# EasyEDA Pro project 立创·天猛星MSPM0G3507开发板.eprj, schematic Schematic

## Sheets
1 core: Board Name: V1.0.2; Create Date: 2025-05-01; Page Name: core; Project Name: 立创·天猛星MSPM0G3507开发板; Schematic Name: Schematic; Update Date: 2025-05-01
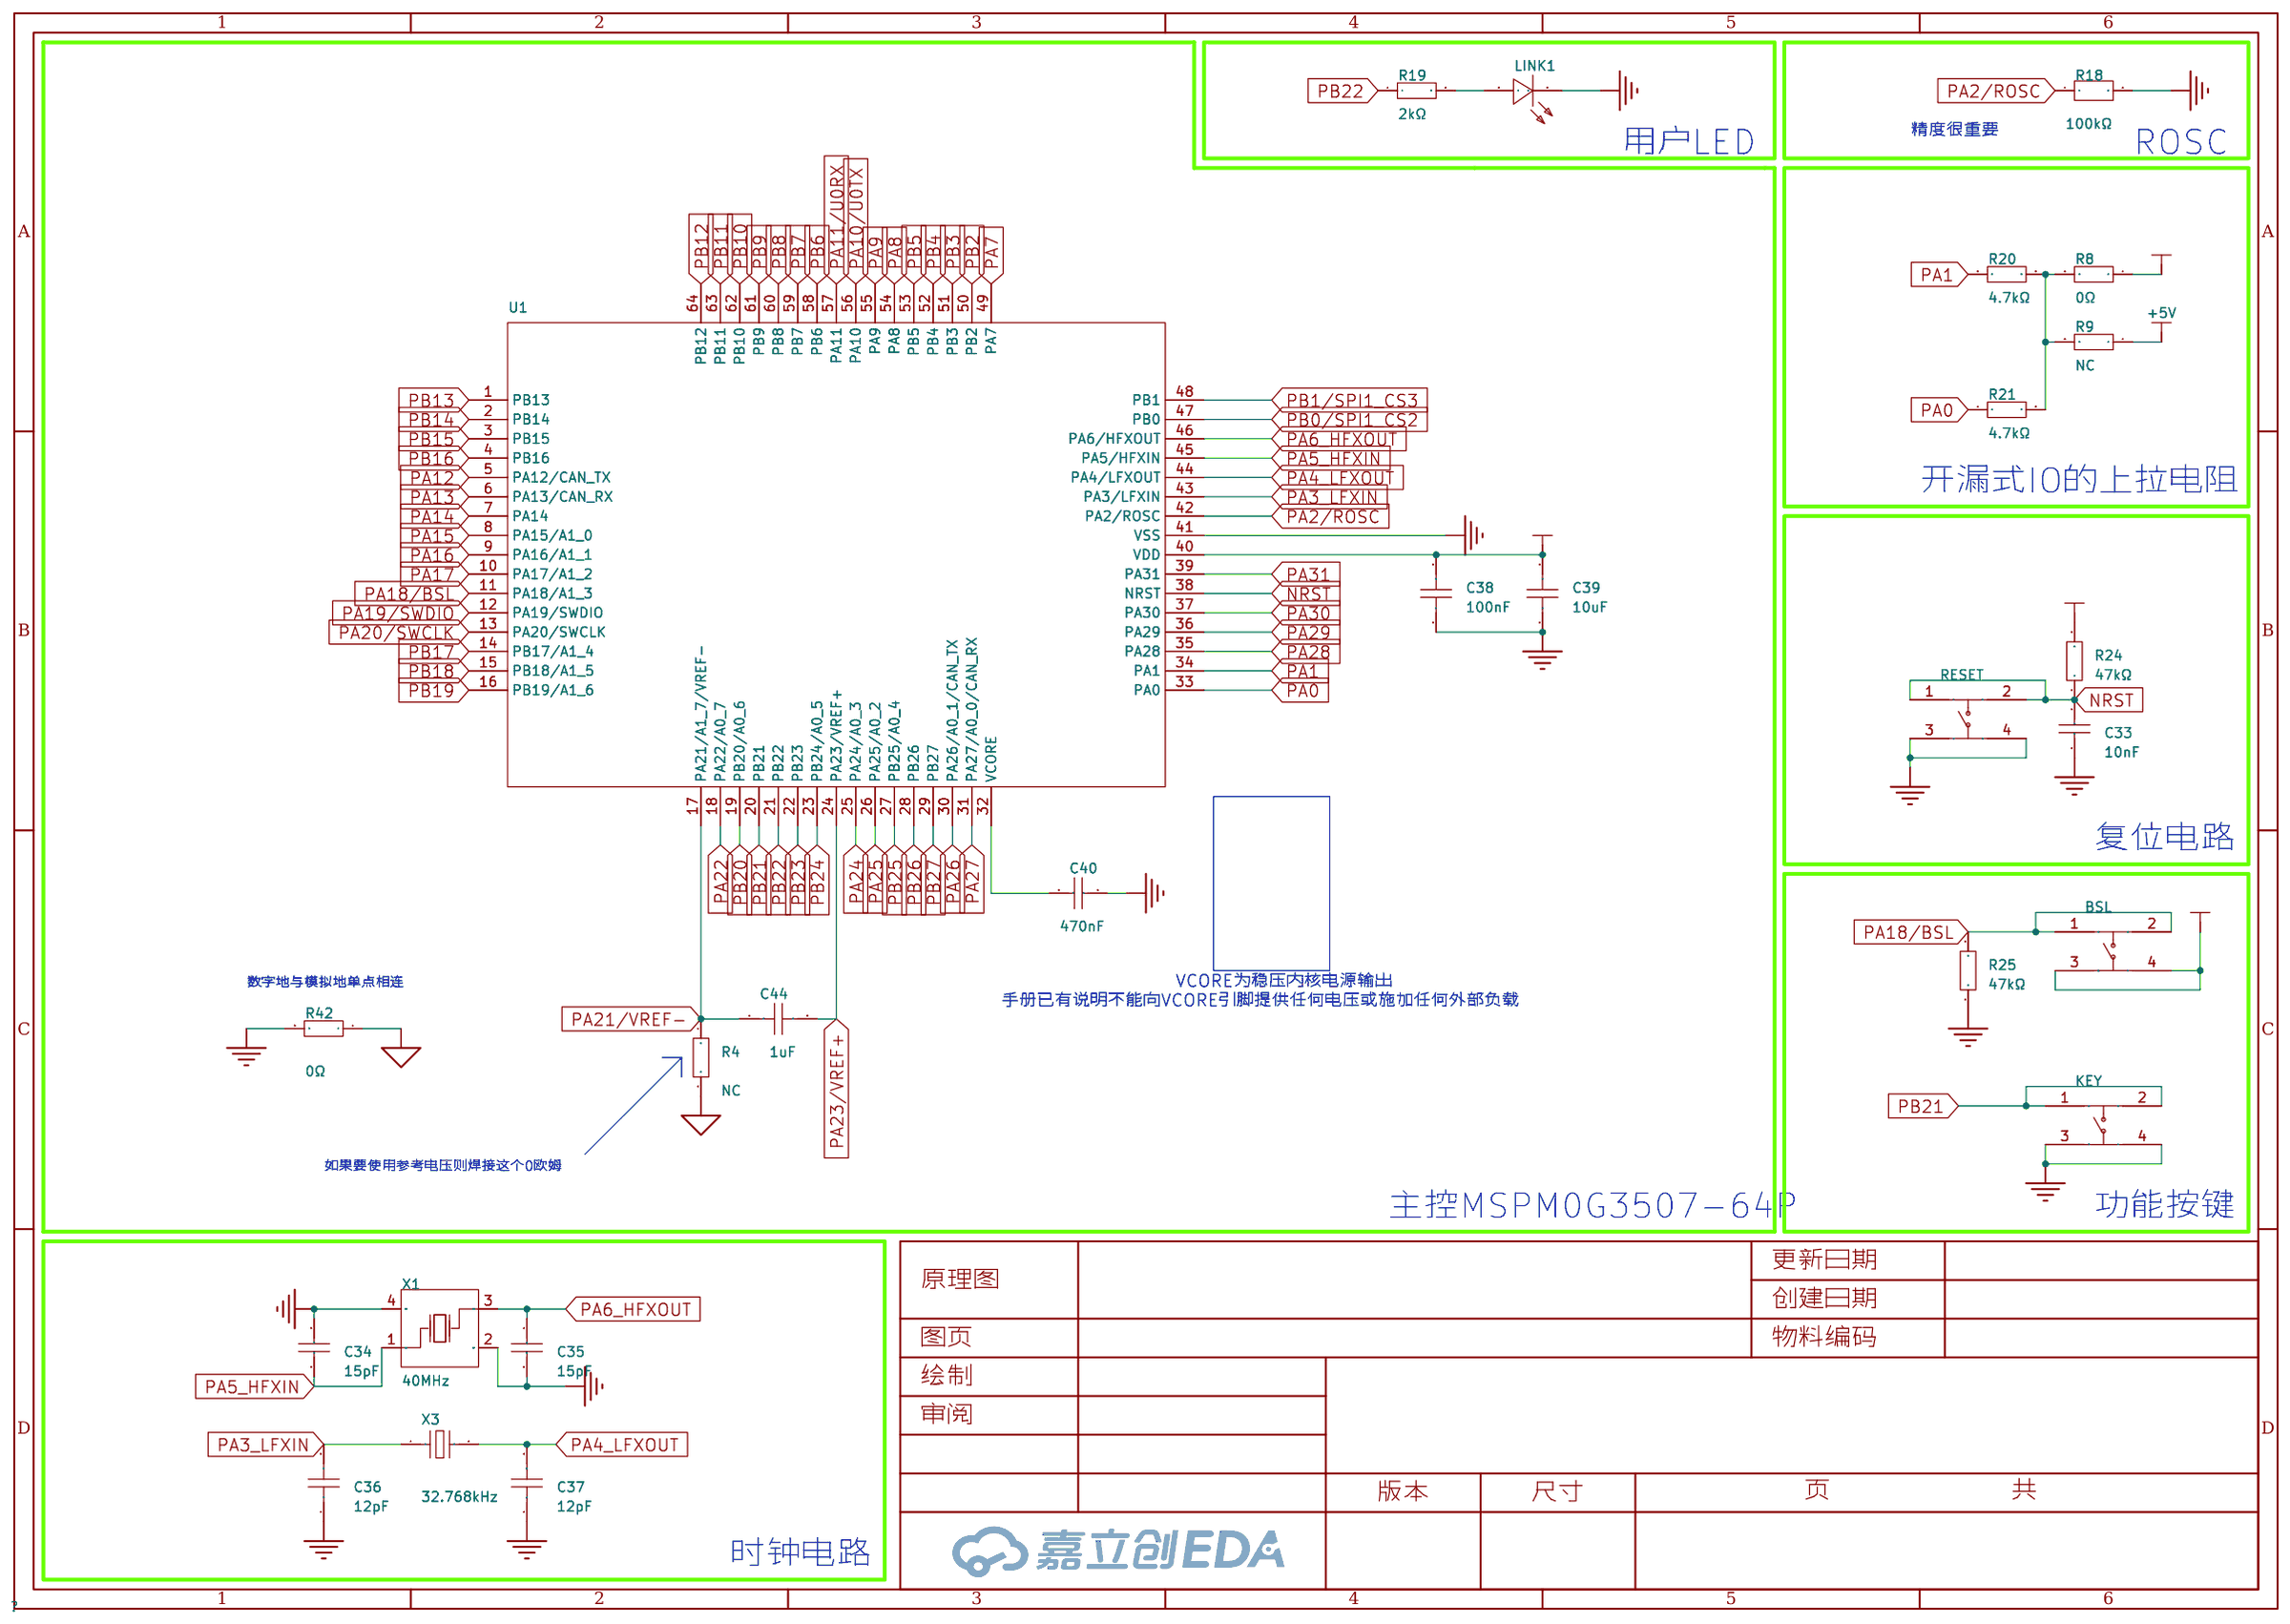
[diagram p0: core]
2 power: Create Date: 2024-11-14; Page Name: power; Update Date: 2024-11-14; Company: 嘉立创EDA; Page Size: A4; Reviewed: 嘉立创EDA
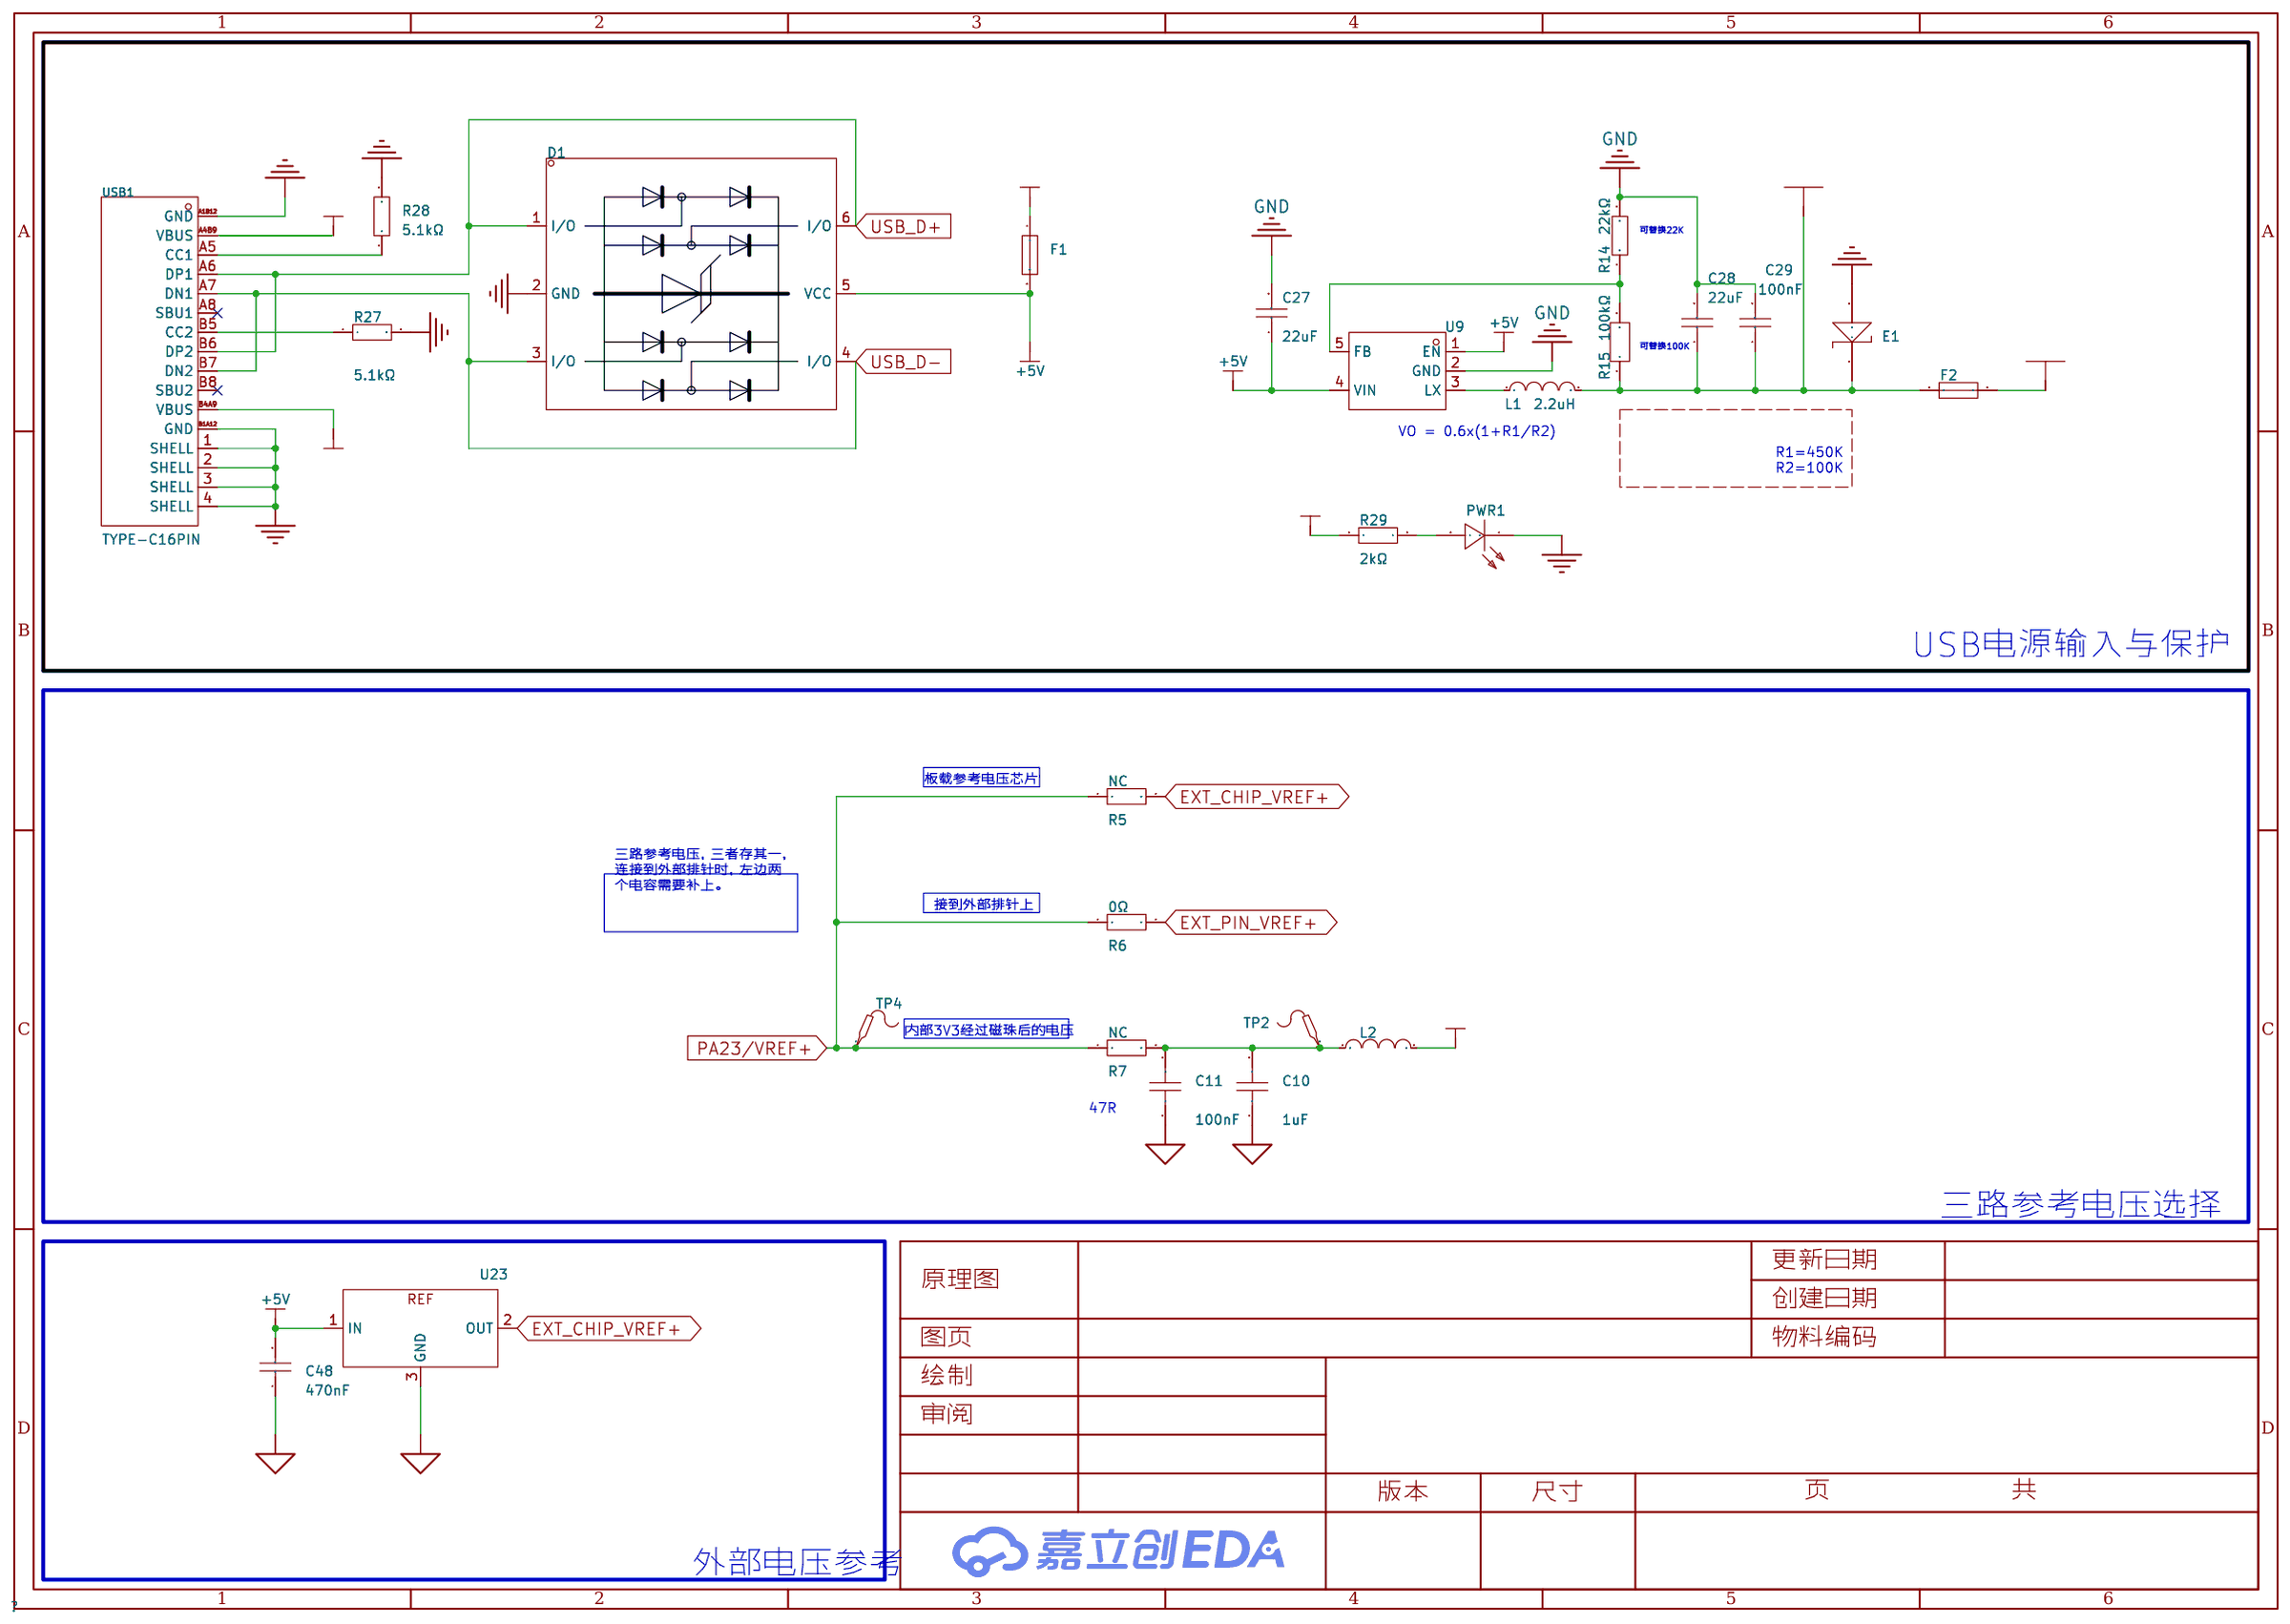
[diagram p1: power]
3 extension: Page Name: extension
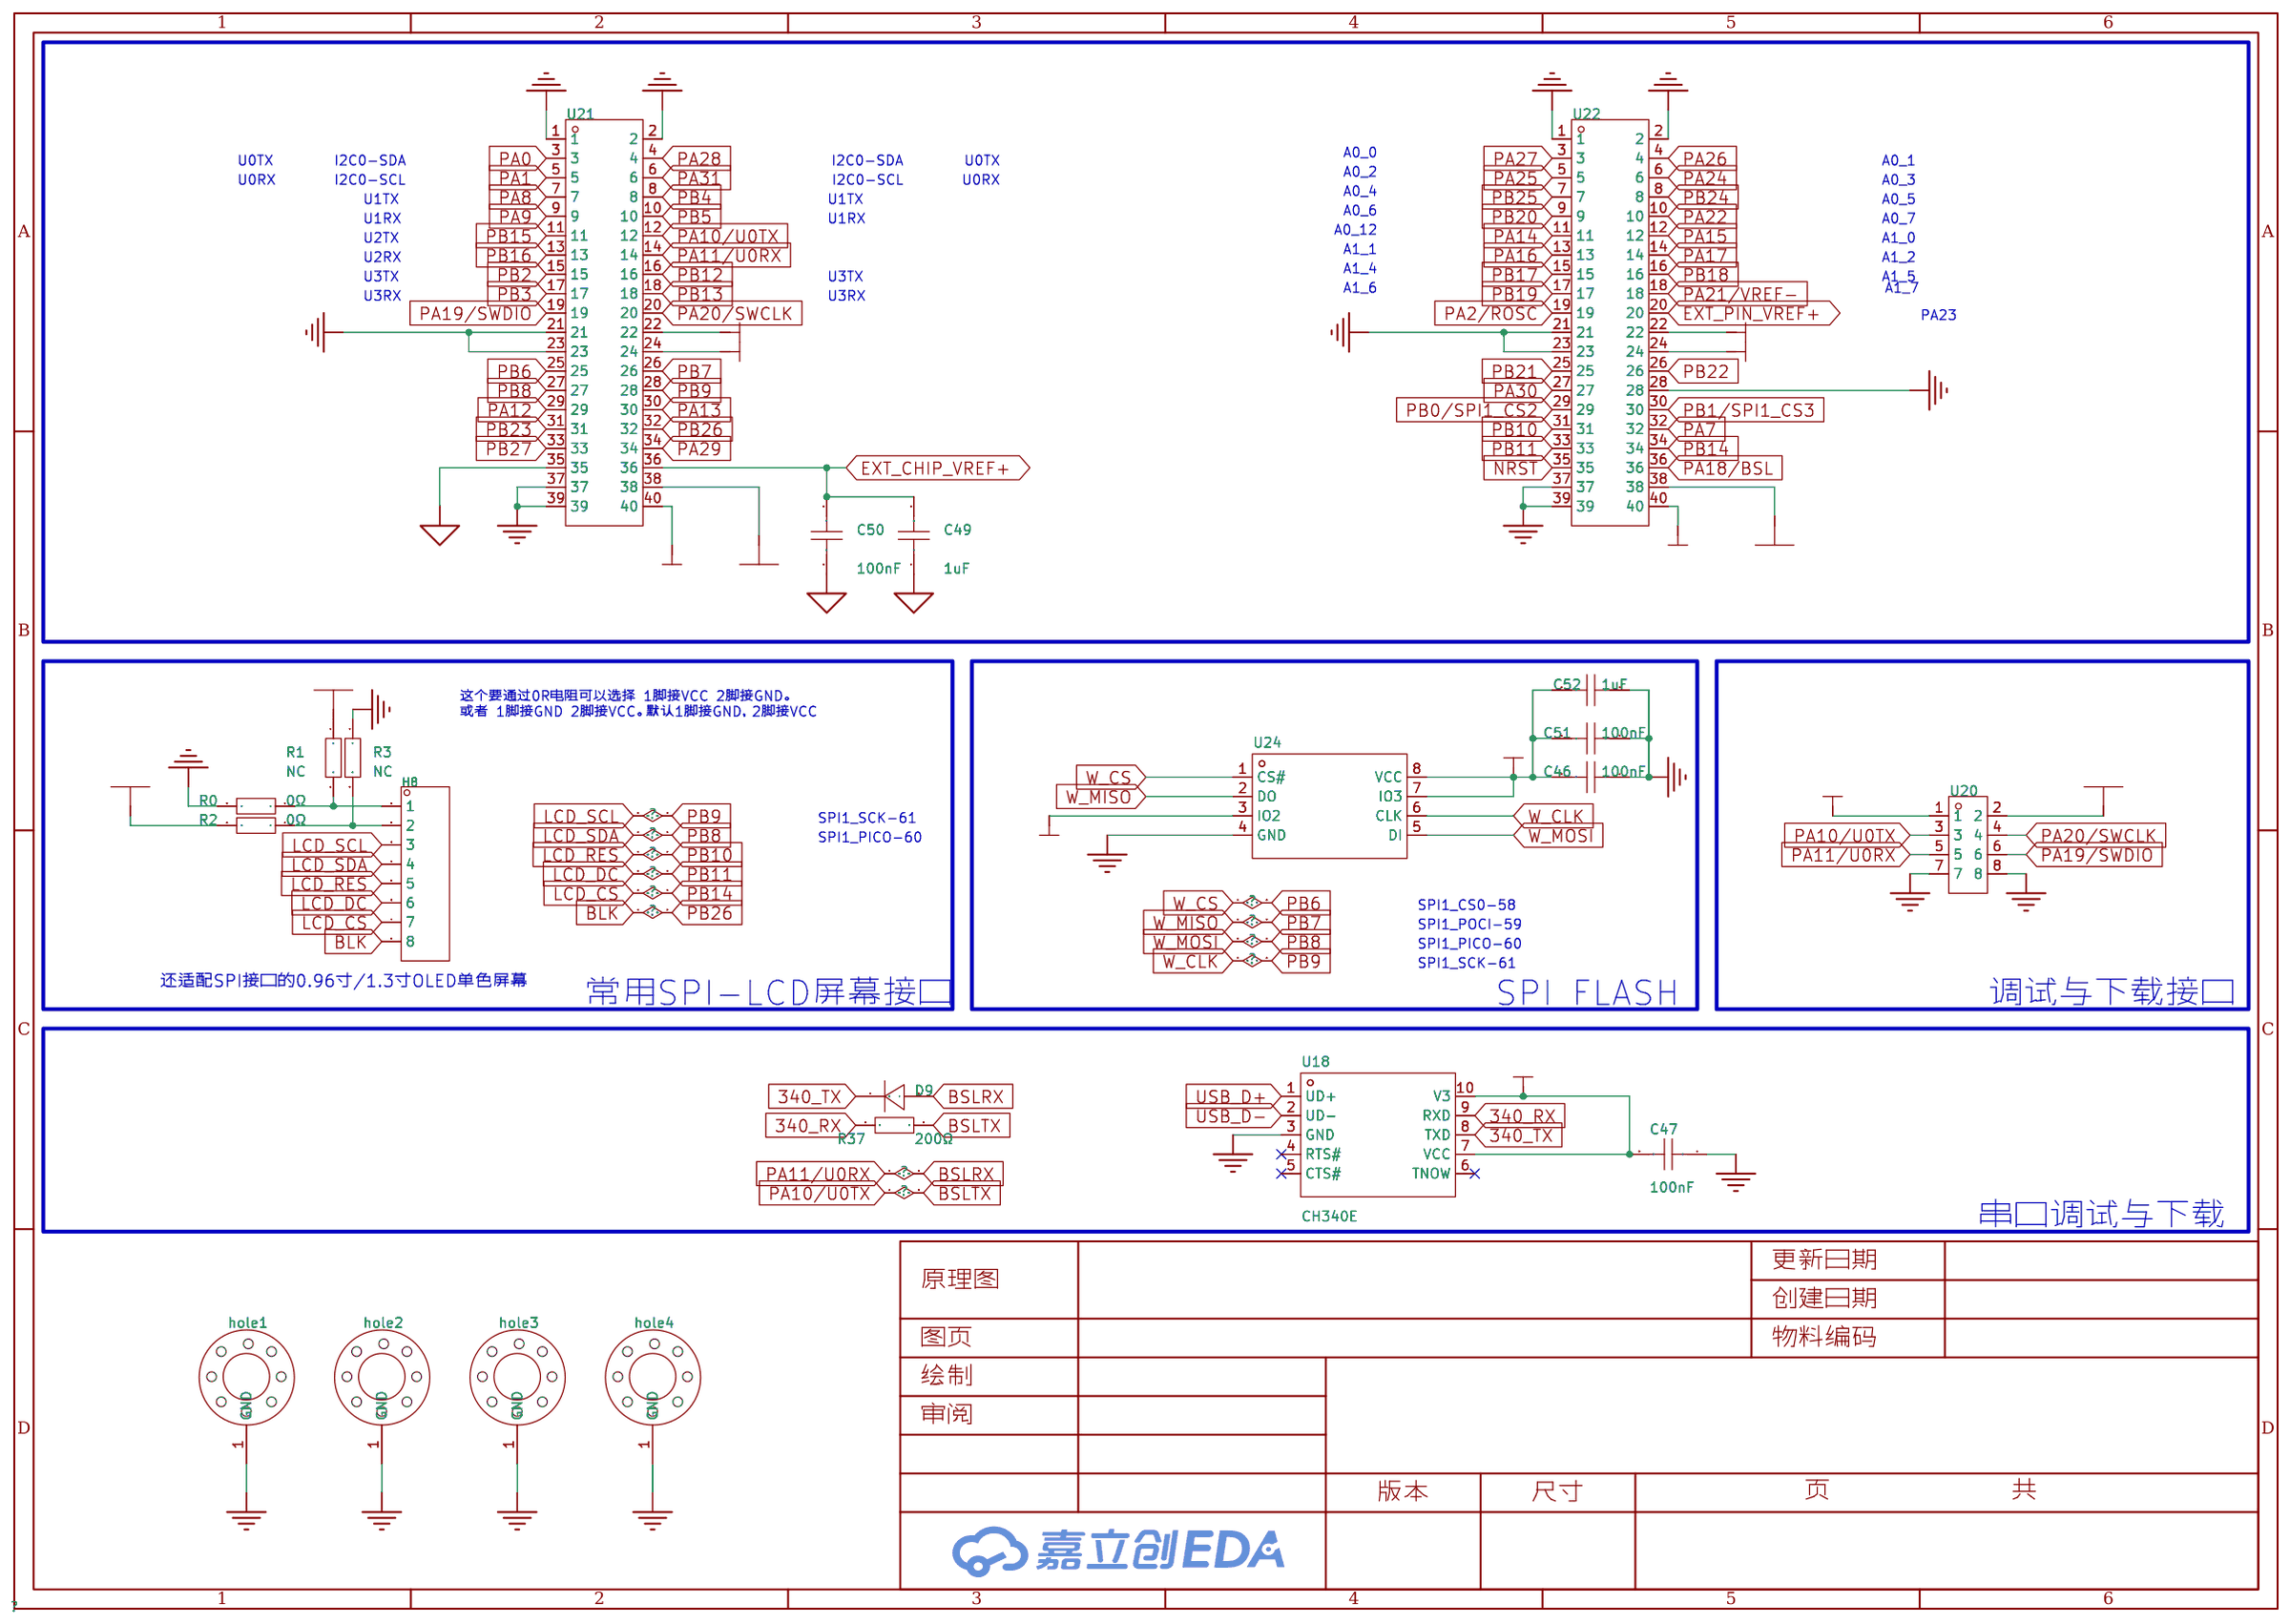
[diagram p2: extension]

## Parts
sheet core
BSL  K2-1808SN-A4SW-01  [KEY-SMD_4P-L4.2-W3.2-P2.20-LS5.1-TL]
C33  10nF  [R0603]
C34  15pF  [R0402]
C35  15pF  [R0402]
C36  12pF  [R0402]
C37  12pF  [R0402]
C38  100nF  [R0402]
C39  10uF  [C0603]
C40  470nF  [R0402]
C44  1uF  [R0603]
KEY  K2-1808SN-A4SW-01  [KEY-SMD_4P-L4.2-W3.2-P2.20-LS5.1-TL]
LINK1  NCD0603G1  [LED0603-RD]
R4  NC  [R0603]
R8  0Ω  [R0603]
R9  NC  [R0603]
R18  100kΩ  [R0402]
R19  2kΩ  [R0603]
R20  4.7kΩ  [R0603]
R21  4.7kΩ  [R0603]
R24  47kΩ  [R0603]
R25  47kΩ  [R0603]
R42  0Ω  [R0603]
RESET  K2-1808SN-A4SW-01  [KEY-SMD_4P-L4.2-W3.2-P2.20-LS5.1-TL]
U1  -  [LQFP-64_L10.0-W10.0-P0.50-LS12.0-TL]
X1  40MHz  [OSC-SMD_4P-L3.2-W2.5-BL_SIT8008BI]
X3  32.768kHz  [OSC-SMD_L3.2-W1.5]
sheet extension
C46  100nF  [R0603]
C47  100nF  [R0603]
C49  1uF  [R0603]
C50  100nF  [R0603]
C51  100nF  [R0603]
C52  1uF  [R0603]
D9  RB521S30T1G  [SOD-523_L1.2-W0.8-LS1.6-RD]
H8  -  [HDR-TH_8P-P2.54-V-M]
hole1  M3  [m3 125x300]
hole2  M3  [m3 125x300]
hole3  M3  [m3 125x300]
hole4  M3  [m3 125x300]
R0  0Ω  [R0603]
R1  NC  [R0603]
R2  0Ω  [R0603]
R3  NC  [R0603]
R37  200Ω  [R0603]
U18  CH340E  [MSOP-10_L3.0-W3.0-P0.50-LS5.0-BL]
U20  2541WV-2x04P  [HDR-TH_8P-P2.54-V-M-R2-C4-S2.54-3]
U21  PZ2.54-2*20  [HDR-TH_40P-P2.54-V-M-R2-C20-S2.54]
U22  PZ2.54-2*20  [HDR-TH_40P-P2.54-V-M-R2-C20-S2.54]
U24  W25Q128JVSIQ  [SOIC-8_L5.3-W5.3-P1.27-LS8.0-BL]
sheet power
C10  1uF  [R0603]
C11  100nF  [R0603]
C27  22uF  [R0603]
C28  22uF  [R0603]
C29  100nF  [R0603]
C48  470nF  [R0603]
D1  BST236A054U  [SOT-23-6_L2.9-W1.6-P0.95-LS2.8-BR]
E1  RLSD52A031V  [SOD-523F_L1.2-W0.8-LS1.7-RD]
F1  BSMD0603-050-6V  [F0603]
F2  BSMD0603-050-6V  [F0603]
L1  2.2uH  [ind-smd_l2.5-w2.0_tfm252012alma2r2mtaa]
L2  GZ1608D601TF  [L0603]
PWR1  NCD0603R1  [LED0603-RD_RED]
R5  NC  [R0603]
R6  0Ω  [R0603]
R7  NC  [R0603]
R14  22kΩ  [R0603]
R15  100kΩ  [R0603]
R27  5.1kΩ  [R0603]
R28  5.1kΩ  [R0603]
R29  2kΩ  [R0603]
TP2  -  [Test-Point-1.27mm]
TP4  -  [Test-Point-1.27mm]
U9  -  [sot-23-5_l2.9-w1.6-p0.95-ls2.8-bl]
U23  REF3033AIDBZR  [SOT-23-3_L3.0-W1.7-P0.95-LS2.9-BR]
USB1  TYPE-C16PIN  [USB-C-SMD_TYPE-C16PIN]

## Library data of the parts
BSL KEY RESET = K2-1808SN-A4SW-01: 触点电流:50mA;额定电压(DC):12V;绝缘电阻:100MΩ;电路结构:单刀单掷;安装方式:立贴;按钮形状:椭圆形按钮;带灯:-;作用力:250gf@±30gf;机械寿命:100000;工作温度:-25℃~+85℃;开关长度:4.2mm;开关宽度:3.25mm;开关高度:2.5mm;; Circuit: 单刀单掷; Supplier: LCSC; Datasheet: https://atta.szlcsc.com/upload/public/pdf/source/20180927/C283535_7E7907F3E7B6C1691E1DC87E363D082A.pdf; Manufacturer: 韩国韩荣; Switch Width: 3.25mm; Supplier Part: C92589; Switch Height: 2.5mm; Switch Length: 4.2mm; Actuator Style: 椭圆形按钮; LCSC Part Name: 4.2mm*3.25mm; Mounting Sytle: 立贴; Contact Current: 50mA; Mechanical Life: 100000; Operating Force: 250gf@±30gf; JLCPCB Part Class: Extended Part; Supplier Footprint: SMD; Voltage Rating (DC): 12V; Insulation Resistance: 100MΩ; Operating Temperature: -25℃~+85℃
C33 = 0603B103K500NT: 容值:10nF;精度:±10%;额定电压:50V;材质(温度系数):X7R;; LCSC Part Name: 10nF ±10% 50V; Supplier Part: C57112; Manufacturer: FH(风华); Supplier Footprint: 0603; JLCPCB Part Class: Basic Part; Datasheet: https://atta.szlcsc.com/upload/public/pdf/source/20200305/C486355_26A10D38EF8C2A5C37091D0039909270.pdf; Supplier: LCSC; Tolerance: ±10%; Voltage Rated: 50V; Temperature Coefficient: X7R
C34 C35 = 0402CG150J500NT: 容值:15pF;精度:±5%;额定电压:50V;材质(温度系数):C0G;; LCSC Part Name: 15pF ±5% 50V; Supplier Part: C1548; Manufacturer: FH(风华); Supplier Footprint: 0402; JLCPCB Part Class: 基础库; Datasheet: https://atta.szlcsc.com/upload/public/pdf/source/20200305/C486355_26A10D38EF8C2A5C37091D0039909270.pdf; Supplier: LCSC; Tolerance: ±5%; Voltage Rated: 50V; Temperature Coefficient: C0G
C36 C37 = CC0402FRNPO9BN120: 容值:12pF;精度:±1%;额定电压:50V;材质(温度系数):NP0;; LCSC Part Name: 12pF ±1% 50V; Supplier Part: C326662; Manufacturer: YAGEO(国巨); Supplier Footprint: 0402; JLCPCB Part Class: 扩展库; Datasheet: https://atta.szlcsc.com/upload/public/pdf/source/20181031/C326662_7F085433F615688AED0238E361F212AA.pdf; Supplier: LCSC; Tolerance: ±1%; Voltage Rated: 50V; Temperature Coefficient: NP0
C38 = CC0402KRX7R7BB104: 容值:100nF;精度:±10%;额定电压:16V;材质(温度系数):X7R;; Supplier: LCSC; Datasheet: https://atta.szlcsc.com/upload/public/pdf/source/20211223/9278FD768280B81DDBEF48FA36411A03.pdf; Tolerance: ±10%; Manufacturer: YAGEO(国巨); Supplier Part: C60474; Voltage Rated: 16V; LCSC Part Name: 100nF ±10% 16V; Supplier Footprint: 0402; Temperature Coefficient: X7R
C39 = CL10A106KP8NNNC: 容值:10uF;精度:±10%;额定电压:10V;材质(温度系数):X5R;; LCSC Part Name: 10uF ±10% 10V; Supplier Part: C19702; Manufacturer: SAMSUNG(三星); Supplier Footprint: 0603; JLCPCB Part Class: 基础库; Datasheet: https://atta.szlcsc.com/upload/public/pdf/source/20160218/1457707763339.pdf; Supplier: LCSC; Tolerance: ±10%; Voltage Rated: 10V; Temperature Coefficient: X5R
C40 = CL05A474KP5NNNC: 容值:470nF;精度:±10%;额定电压:10V;材质(温度系数):X5R;; LCSC Part Name: 470nF ±10% 10V; Supplier Part: C47339; Manufacturer: SAMSUNG(三星); Supplier Footprint: 0402; JLCPCB Part Class: 扩展库; Datasheet: https://atta.szlcsc.com/upload/public/pdf/source/20160218/1457707763339.pdf; Supplier: LCSC; Tolerance: ±10%; Voltage Rated: 10V; Temperature Coefficient: X5R
C10 C44 C49 C52 = CL10A105KB8NNNC: 容值:1uF;精度:±10%;额定电压:50V;材质(温度系数):X5R;; LCSC Part Name: 1uF ±10% 50V; Supplier Part: C15849; Manufacturer: SAMSUNG(三星); Supplier Footprint: 0603; JLCPCB Part Class: Basic Part; Datasheet: https://atta.szlcsc.com/upload/public/pdf/source/20160218/1457707763339.pdf; Supplier: LCSC; Tolerance: ±10%; Voltage Rated: 50V; Temperature Coefficient: X5R
LINK1 = NCD0603G1: 发光颜色:翠绿色;正向电压(VF):2.6V~3.6V;功率:72mW;正向电流:10mA;主波长:515nm~530nm;透镜颜色:无色透明透镜;发光强度:330mcd~900mcd;发光角度:130°;工作温度:-30℃~+85℃;; Supplier Part: C84267; Manufacturer: 国星光电; Supplier Footprint: 0603; JLCPCB Part Class: Extended Part; Datasheet: https://atta.szlcsc.com/upload/public/pdf/source/20200820/C84267_04BA7703640BAC111D09F5EFB971FBF3.pdf; Supplier: LCSC; Emitted Color: 翠绿色; Forward Voltage (VF): 2.6V~3.6V; Power Dissipation: 72mW; Forward Current: 10mA; Dominant Wavelength: 515nm~530nm; Lens Color: 无色透明透镜; Luminous Intensity: 330mcd~900mcd; Viewing Angle: 130°; Operating Temperature: -30℃~+85℃
R0-R4 R8 R9 R42 = 0603WAF0000T5E: 电阻类型:厚膜电阻;阻值:0Ω;精度:±1%;功率:100mW;最大工作电压:75V;; LCSC Part Name: 0Ω ±1% 100mW 厚膜电阻; Supplier Part: C21189; Manufacturer: UNI-ROYAL(厚声); Supplier Footprint: 0603; JLCPCB Part Class: Basic Part; Datasheet: https://atta.szlcsc.com/upload/public/pdf/source/20200306/C422600_1E6D84923E4A46A82E41ADD87F860B5C.pdf; Supplier: LCSC; Type: 厚膜电阻; Tolerance: ±1%; Power(Watts): 100mW; Overload Voltage (Max): 75V; Operating Temperature Range: -55℃~+155℃; Temperature Coefficient: ±800ppm/℃
R18 = RT0402BRD07100KL: 电阻类型:薄膜电阻;阻值:100kΩ;精度:±0.1%;功率:62.5mW;最大工作电压:50V;温度系数:±25ppm/℃;; LCSC Part Name: 薄膜电阻 100kΩ ±0.1% 62.5mW; Supplier Part: C852472; Manufacturer: YAGEO(国巨); Supplier Footprint: 0402; JLCPCB Part Class: 扩展库; Datasheet: https://atta.szlcsc.com/upload/public/pdf/source/20210326/C852472_6283D268A9C33EA67274729CC55E28B1.pdf; Supplier: LCSC; Type: 薄膜电阻; Tolerance: ±0.1%; Power(Watts): 62.5mW; Overload Voltage (Max): 50V; Temperature Coefficient: ±25ppm/℃; Operating Temperature Range: -55℃~+155℃
R19 R29 = 0603WAF2001T5E: 电阻类型:厚膜电阻;阻值:2kΩ;精度:±1%;功率:100mW;最大工作电压:75V;温度系数:±100ppm/℃;; LCSC Part Name: 2kΩ ±1% 100mW 厚膜电阻; Supplier Part: C22975; Manufacturer: UNI-ROYAL(厚声); Supplier Footprint: 0603; JLCPCB Part Class: Basic Part; Datasheet: https://atta.szlcsc.com/upload/public/pdf/source/20200306/C422600_1E6D84923E4A46A82E41ADD87F860B5C.pdf; Supplier: LCSC; Type: 厚膜电阻; Tolerance: ±1%; Power(Watts): 100mW; Overload Voltage (Max): 75V; Temperature Coefficient: ±100ppm/℃; Operating Temperature Range: -55℃~+155℃
R20 R21 = 0603WAF4701T5E: 电阻类型:厚膜电阻;阻值:4.7kΩ;精度:±1%;功率:100mW;最大工作电压:75V;温度系数:±100ppm/℃;; LCSC Part Name: 4.7kΩ ±1% 100mW 厚膜电阻; Supplier Part: C23162; Manufacturer: UNI-ROYAL(厚声); Supplier Footprint: 0603; JLCPCB Part Class: Basic Part; Datasheet: https://atta.szlcsc.com/upload/public/pdf/source/20200306/C422600_1E6D84923E4A46A82E41ADD87F860B5C.pdf; Supplier: LCSC; Type: 厚膜电阻; Tolerance: ±1%; Power(Watts): 100mW; Overload Voltage (Max): 75V; Temperature Coefficient: ±100ppm/℃; Operating Temperature Range: -55℃~+155℃
R24 R25 = 0603WAF4702T5E: 电阻类型:厚膜电阻;阻值:47kΩ;精度:±1%;功率:100mW;最大工作电压:75V;温度系数:±100ppm/℃;; LCSC Part Name: 47kΩ ±1% 100mW 厚膜电阻; Supplier Part: C25819; Manufacturer: UNI-ROYAL(厚声); Supplier Footprint: 0603; JLCPCB Part Class: Basic Part; Datasheet: https://atta.szlcsc.com/upload/public/pdf/source/20200306/C422600_1E6D84923E4A46A82E41ADD87F860B5C.pdf; Supplier: LCSC; Type: 厚膜电阻; Tolerance: ±1%; Power(Watts): 100mW; Overload Voltage (Max): 75V; Temperature Coefficient: ±100ppm/℃; Operating Temperature Range: -55℃~+155℃
U1 = MSPM0G3507: MSPM0G3507的器件与封装; Manufacturer: TI(德州仪器); Manufacturer Part: MSPM0G3507SPMR; Supplier Part: C22389960; Datasheet: https://atta.szlcsc.com/upload/public/pdf/source/20240621/D7254EAE03B6DB9B67DC0EA221DC405D.pdf
X1 = X322540MPB4SI: 频率:40MHz;频率公差:±10ppm;负载电容:15pF;; Supplier: LCSC; Datasheet: https://atta.szlcsc.com/upload/public/pdf/source/20210329/C112971_1F611BDC486E193C1706F6D8EB5AA189.pdf; Crystal Type: 贴片无源晶振; Manufacturer: YXC(扬兴晶振); Supplier Part: C9010; LCSC Part Name: 40MHz ±10ppm 15pF YSX321SL; Load Capacitance: 15pF; JLCPCB Part Class: Extended Part; Supplier Footprint: SMD3225-4P; Frequency Stability: ±30ppm; Frequency Tolerance: ±10ppm; Operating Temperature: -40℃~+85℃
X3 = X321532768KGD2SI: 晶振类型:贴片晶振;频率:32.768kHz;常温频差:±20ppm;外接负载电容:12.5pF;频率稳定度(全温):-;; LCSC Part Name: 32.768kHz ±20ppm 12.5pF; Supplier Part: C620155; Manufacturer: YXC(扬兴晶振); Supplier Footprint: SMD3215-2P; JLCPCB Part Class: 扩展库; Datasheet: https://atta.szlcsc.com/upload/public/pdf/source/20240329/3A7650FD985DD0DE85694D3785AB4916.pdf; Supplier: LCSC; Crystal Type: 贴片晶振; Normal temperature Frequency Tolerance: ±20ppm; External load capacitor: 12.5pF; Operating Temperature: -40℃~+85℃
C11 C29 C46 C47 C50 C51 = CC0603KRX7R9BB104: 容值:100nF;精度:±10%;额定电压:50V;材质(温度系数):X7R;; LCSC Part Name: 100nF ±10% 50V; Supplier Part: C14663; Manufacturer: YAGEO(国巨); Supplier Footprint: 0603; JLCPCB Part Class: Basic Part; Datasheet: https://atta.szlcsc.com/upload/public/pdf/source/20180910/C282072_33301C7F631E79921B82A8DAC6BCC5B3.pdf; Supplier: LCSC; Tolerance: ±10%; Voltage Rated: 50V; Temperature Coefficient: X7R
D9 = RB521S30T1G: 正向压降(Vf):500mV@200mA;直流反向耐压(Vr):30V;平均整流电流(Io):200mA;; LCSC Part Name: 电压:30V 电流:200mA; Supplier Part: C145179; Manufacturer: onsemi(安森美); Supplier Footprint: SOD-523; JLCPCB Part Class: 扩展库; Datasheet: https://atta.szlcsc.com/upload/public/pdf/source/20180112/C145179_15157255310311261265.PDF; Supplier: LCSC; Forward Voltage (Vf@If): 500mV@200mA; Reverse Voltage (Vr): 30V; Average Rectified Current (Io): 200mA; Reverse Leakage Current (Ir): 30uA@10V
H8 = HDR-M_2.54_1x8P: Supplier Part: NC; Supplier Footprint: 插件
hole1-hole4 = m3_梅花螺丝孔: 梅花螺丝孔; Check: false
R37 = 0603WAF2000T5E: 电阻类型:厚膜电阻;阻值:200Ω;精度:±1%;功率:100mW;最大工作电压:75V;温度系数:±100ppm/℃;; LCSC Part Name: 200Ω ±1% 100mW 厚膜电阻; Supplier Part: C8218; Manufacturer: UNI-ROYAL(厚声); Supplier Footprint: 0603; JLCPCB Part Class: Basic Part; Datasheet: https://atta.szlcsc.com/upload/public/pdf/source/20200306/C422600_1E6D84923E4A46A82E41ADD87F860B5C.pdf; Supplier: LCSC; Type: 厚膜电阻; Tolerance: ±1%; Power(Watts): 100mW; Overload Voltage (Max): 75V; Temperature Coefficient: ±100ppm/℃; Operating Temperature Range: -55℃~+155℃
U18 = CH340E: 应用功能:收发器;接口协议:USB 2.0;数据速率:2Mbps;; Protocol: USB 2.0; Supplier: LCSC; Data Rate: 2Mbps; Datasheet: https://atta.szlcsc.com/upload/public/pdf/source/20200819/C99652_97FFC0DF2539BFF05CD752AD9221D632.pdf; Manufacturer: WCH(南京沁恒); Supplier Part: C99652; LCSC Part Name: USB转串口芯片 CH340; Supply Voltage: 3.3V；5V; JLCPCB Part Class: Extended Part; Supplier Footprint: MSOP-10; Applications Function: 收发器
U20 = 2541WV-2x04P: 插针结构:2x4P;间距:2.54mm;安装类型:直插;排数:双排;总PIN位数:8P;配合针长度:6mm;塑高:2.54mm;端接针长度:3mm;; Supplier Part: NC; Manufacturer: HanElectricity(瀚源); Supplier Footprint: 插件,P=2.54mm; Datasheet: https://atta.szlcsc.com/upload/public/pdf/source/20230330/E6AE37B56C45D0CDA24B058754300644.pdf; Supplier: LCSC; Pin Structure: 2x4P; Pitch: 2.54mm; Mounting Type: 直插; Number of Rows: 双排; Number of Pins: 8P; Length of Mating Pin: 6mm; Insulation Height: 2.54mm; Length of End Connection Pin: 3mm
U21 U22 = PZ2.54-2*20: 插针结构:2x20P;间距:2.54mm;安装类型:直插;排数:双排;总PIN位数:40P;触头镀层:金;; Supplier Part: C5224014; Manufacturer: ZHOURI(洲日); Supplier Footprint: 插件,P=2.54mm; JLCPCB Part Class: 扩展库; Datasheet: https://atta.szlcsc.com/upload/public/pdf/source/20221102/7E8316C38DB6D81BB18273F4CFF8B2F6.pdf; Supplier: LCSC; Pin Structure: 2x20P; Pitch: 2.54mm; Mounting Type: 直插; Number of Rows: 双排; Number of Pins: 40P; Contact Plating: 金
U24 = W25Q128JVSIQ: 接口类型:-;存储容量:128Mbit;时钟频率(fc):-;; LCSC Part Name: W25Q128JVSIQ 编带; Supplier Part: C97521; Manufacturer: WINBOND(华邦); Supplier Footprint: SOIC-8-208mil; JLCPCB Part Class: 基础库; Datasheet: https://atta.szlcsc.com/upload/public/pdf/source/20170316/1489627409956.pdf; Supplier: LCSC; Memory Size: 128Mbit
C27 C28 = CC0603MRX5R6BB226: 容值:22uF;精度:±20%;额定电压:10V;温度系数:X5R;; LCSC Part Name: 22uF ±20% 10V; Supplier Part: C109447; Manufacturer: YAGEO(国巨); Supplier Footprint: 0603; JLCPCB Part Class: Extended Part; Datasheet: https://atta.szlcsc.com/upload/public/pdf/source/20180326/C109447_128EE839559AD0983BD0B536C3EA96EC.pdf; Supplier: LCSC; Tolerance: ±20%; Voltage Rated: 10V; Temperature Coefficient: X5R
C48 = CL10B474KA8NNNC: 容值:470nF;精度:±10%;额定电压:25V;材质(温度系数):X7R;; LCSC Part Name: 470nF ±10% 25V; Supplier Part: C1623; Manufacturer: SAMSUNG(三星); Supplier Footprint: 0603; JLCPCB Part Class: Basic Part; Datasheet: https://atta.szlcsc.com/upload/public/pdf/source/20160218/1457707763339.pdf; Supplier: LCSC; Tolerance: ±10%; Voltage Rated: 25V; Temperature Coefficient: X7R
D1 = BST236A054U（自修改）: 反向关断电压（典型值）:5V;击穿电压（最小值）:6V;极性:-;箝位电压:13V;峰值脉冲电流（10/1000us）:3.5A (8/20us);; Supplier: LCSC; Datasheet: https://atta.szlcsc.com/upload/public/pdf/source/20190723/C406203_BF93A0BD7D0538F0A550B5A01DEB1E59.pdf; Manufacturer: BORN(伯恩半导体); Supplier Part: C406203; JLCPCB Part Class: 扩展库; Supplier Footprint: SOT23-6
E1 = RLSD52A031V: 极性:单向;反向截止电压(Vrwm):3.3V;最大钳位电压:6.5V;峰值脉冲电流(Ipp)@10/1000us:5A;; LCSC Part Name: 单向ESD; Supplier Part: C20931; Manufacturer: RUILON(瑞隆源); Supplier Footprint: SOD-523; JLCPCB Part Class: 扩展库; Datasheet: https://atta.szlcsc.com/upload/public/pdf/source/20230927/48F1BA5AFABEFE02EDB61ED3DAE40BB2.pdf; Supplier: LCSC; polarity: 单向; Reverse Stand-Off Voltage (Vrwm): 3.3V; Maximum Clamping Voltage: 6.5V; Peak Pulse Current (Ipp)@10/1000us: 5A; Type: ESD
F1 F2 = BSMD0603-050-6V: 最大电压:6V;最大电流:40A;保持电流:500mA;跳闸电流:1A;; Supplier: LCSC; Datasheet: https://atta.szlcsc.com/upload/public/pdf/source/20220302/2A4AFA61964160B34367BDE2745D6217.pdf; Hold Current: 500mA; Manufacturer: BHFUSE(佰宏); Trip Current: 1A; Supplier Part: C883095; LCSC Part Name: 6V 500mA 0603自恢复; JLCPCB Part Class: 扩展库; Power Dissipation: 500mW; Supplier Footprint: 0603; Current Rating (Max): 40A; Maximum Time to Trip: 100ms; Operating Temperature: -40℃~+85℃; Operating Voltage (Max): 6V; Resistance - Initial (Ri) (Min): 100mΩ; Resistance - Post Trip (R1) (Max): 800mΩ
L1 = mip25202r2mbe: 电感值:2.2uH;精度:±20%;额定电流:1.3A;饱和电流(Isat):-;直流电阻(DCR):80mΩ;; LCSC Part Name: 2.2uH ±20% 1.3A 80mΩ; Supplier Part: C315721; Manufacturer: INPAQ(台湾佳邦); Manufacturer Part: MIP25202R2MBE; Supplier Footprint: 1008; JLCPCB Part Class: Extended Part; Datasheet: https://atta.szlcsc.com/upload/public/pdf/source/20181022/C315721_463E375DBAFE95D8F262A43BB2997154.pdf; Supplier: LCSC; Tolerance: ±20%; Rated Current: 1.3A; DC Resistance (DCR): 80mΩ
L2 = GZ1608D601TF: 标称阻抗@测试频率:600Ω@100MHz;误差:±25%;直流电阻(RDC):450mΩ;; Circuits: 1; Supplier: LCSC; Datasheet: https://atta.szlcsc.com/upload/public/pdf/source/20210830/355EA7C0FAC5394FC0FE3F17C770C20A.pdf; Tolerance: ±25%; Manufacturer: Sunlord(顺络); DC Resistance: 450mΩ; Supplier Part: C1002; Current Rating: 200mA; LCSC Part Name: 单路 0603磁珠 阻抗600Ω@100MHz; Supplier Footprint: 0603; Impedance @ Frequency: 600Ω@100MHz
PWR1 = NCD0603R1_C84263: 灯头类型:-;发光颜色:红色;正向电压(VF):1.6V~2.6V;功率:65mW;正向电流:20mA;主波长:615nm~630nm;二极管配置:独立二极管;透镜颜色:无色透明透镜;色温:-;发光强度:80mcd~220mcd;发光角度:130°;载带方式:-;工作温度:-30℃~+85℃;; Supplier Part: C84263; Manufacturer: 国星光电; Supplier Footprint: 0603; JLCPCB Part Class: Extended Part; Datasheet: https://atta.szlcsc.com/upload/public/pdf/source/20200820/C84263_DABC6A75E58F576973B407FDBA283D60.pdf; Supplier: LCSC; Emitted Color: 红色; Forward Voltage (VF): 1.6V~2.6V; Power Dissipation: 65mW; Forward Current: 20mA; Dominant Wavelength: 615nm~630nm; Diode Configuration: 独立二极管; Lens Color: 无色透明透镜; Luminous Intensity: 80mcd~220mcd; Viewing Angle: 130°; Operating Temperature: -30℃~+85℃
R5 R6 = 0603WAF0000T5E: 电阻类型:厚膜电阻;阻值:0Ω;精度:±1%;功率:100mW;最大工作电压:75V;; LCSC Part Name: 0Ω ±1% 100mW 厚膜电阻; Supplier Part: C21189; Manufacturer: UNI-ROYAL(厚声); Supplier Footprint: 0603; JLCPCB Part Class: Basic Part; Datasheet: https://atta.szlcsc.com/upload/public/pdf/source/20200306/C422600_1E6D84923E4A46A82E41ADD87F860B5C.pdf; Supplier: LCSC; Type: 厚膜电阻; Tolerance: ±1%; Power(Watts): 100mW; Overload Voltage (Max): 75V; Operating Temperature Range: -55℃~+155℃; Temperature Coefficient: ±800ppm/℃; 不贴标志: X
R7 = 0603WAF470JT5E: 电阻类型:厚膜电阻;阻值:47Ω;精度:±1%;功率:100mW;最大工作电压:75V;温度系数:±100ppm/℃;; LCSC Part Name: 47Ω ±1% 100mW 厚膜电阻; Supplier Part: C23182; Manufacturer: UNI-ROYAL(厚声); Supplier Footprint: 0603; JLCPCB Part Class: Basic Part; Datasheet: https://atta.szlcsc.com/upload/public/pdf/source/20200306/C422600_1E6D84923E4A46A82E41ADD87F860B5C.pdf; Supplier: LCSC; Type: 厚膜电阻; Tolerance: ±1%; Power(Watts): 100mW; Overload Voltage (Max): 75V; Temperature Coefficient: ±100ppm/℃; Operating Temperature Range: -55℃~+155℃
R14 = 0603WAF2202T5E: 电阻类型:厚膜电阻;阻值:22kΩ;精度:±1%;功率:100mW;最大工作电压:75V;温度系数:±100ppm/℃;; LCSC Part Name: 22kΩ ±1% 100mW 厚膜电阻; Supplier Part: C31850; Manufacturer: UNI-ROYAL(厚声); Supplier Footprint: 0603; JLCPCB Part Class: Basic Part; Datasheet: https://atta.szlcsc.com/upload/public/pdf/source/20200306/C422600_1E6D84923E4A46A82E41ADD87F860B5C.pdf; Supplier: LCSC; Type: 厚膜电阻; Tolerance: ±1%; Power(Watts): 100mW; Overload Voltage (Max): 75V; Temperature Coefficient: ±100ppm/℃; Operating Temperature Range: -55℃~+155℃; LCSC Stock: 4466581; LCSC On Sale: 1; Price: 0.004; JLCPCB Stock: 621420; JLCPCB On Sale: 1
R15 = 0603WAF1003T5E: 电阻类型:厚膜电阻;阻值:100kΩ;精度:±1%;功率:100mW;最大工作电压:75V;温度系数:±100ppm/℃;; LCSC Part Name: 100kΩ ±1% 100mW 厚膜电阻; Supplier Part: C25803; Manufacturer: UNI-ROYAL(厚声); Supplier Footprint: 0603; JLCPCB Part Class: Basic Part; Datasheet: https://atta.szlcsc.com/upload/public/pdf/source/20200306/C422600_1E6D84923E4A46A82E41ADD87F860B5C.pdf; Supplier: LCSC; Type: 厚膜电阻; Tolerance: ±1%; Power(Watts): 100mW; Overload Voltage (Max): 75V; Temperature Coefficient: ±100ppm/℃; Operating Temperature Range: -55℃~+155℃; LCSC Stock: 1478; LCSC On Sale: 1; Price: 0.004; JLCPCB Stock: 0
R27 R28 = 0603WAF5101T5E: 电阻类型:厚膜电阻;阻值:5.1kΩ;精度:±1%;功率:100mW;最大工作电压:75V;温度系数:±100ppm/℃;; LCSC Part Name: 5.1kΩ ±1% 100mW 厚膜电阻; Supplier Part: C23186; Manufacturer: UNI-ROYAL(厚声); Supplier Footprint: 0603; JLCPCB Part Class: Basic Part; Datasheet: https://atta.szlcsc.com/upload/public/pdf/source/20200306/C422600_1E6D84923E4A46A82E41ADD87F860B5C.pdf; Supplier: LCSC; Type: 厚膜电阻; Tolerance: ±1%; Power(Watts): 100mW; Overload Voltage (Max): 75V; Temperature Coefficient: ±100ppm/℃; Operating Temperature Range: -55℃~+155℃
TP2 TP4 = Test-Point: Test Point 测试点
U9 = tmi3411: 电源管理IC,DCDC,Buck,1MHz,2.3~6V,2A,SOT23-5,VFB=0.6V,TMI3411(TMI); LCSC Part Name: TMI3411; Supplier Part: C478952; Manufacturer: TMI(拓尔微); Manufacturer Part: TMI3411; LCSC Stock: 7108; LCSC On Sale: 1; Supplier Footprint: SOT-23-5; Price: 0.793; JLCPCB Part Class: Extended Part; JLCPCB Stock: 570; JLCPCB On Sale: 1; Datasheet: https://atta.szlcsc.com/upload/public/pdf/source/20200106/C478952_0771C44371C5553A1E48566244E442F9.pdf; Supplier: LCSC
U23 = REF3033AIDBZR: 输出类型:固定;输入电压:3.35V~5.5V;输出电压:3.3V;输出电流:25mA;精度:±0.2%;; Supplier Part: C36658; Manufacturer: TI(德州仪器); Supplier Footprint: SOT-23; JLCPCB Part Class: 扩展库; Datasheet: https://www.ti.com/cn/lit/gpn/ref3020; Supplier: LCSC; Output Type: 固定; Input Voltage: 3.35V~5.5V; Output Voltage: 3.3V; Output Current: 25mA; Tolerance: ±0.2%; Temperature Coefficient: 75ppm/℃; Reference Type: 串联; Supply Current: 50uA; Noise - 10Hz to 10kHz: 105uVrms; Operating Temperature: -40℃~+125℃@(Ta)
USB1 = TYPE-C16PIN: 连接器类型:Type-C;标准:-;公母:母座;触点数量:16P;端口数量:1;安装方式:卧贴;额定电流 - 电源:3A;工作温度范围:-40℃~+85℃;; Gender: 母座; Supplier: LCSC; Datasheet: https://atta.szlcsc.com/upload/public/pdf/source/20190521/C393939_7B9043D4CF1026AF443AB60D91FBCD5C.pdf; Manufacturer: SHOU HAN(首韩); Supplier Part: C393939; Connector Type: Type-C; LCSC Part Name: Type-C 母座 卧贴 快充闪充 停产; Mounting Style: 卧贴; Number of Ports: 1; JLCPCB Part Class: Extended Part; Number of Contacts: 16P; Supplier Footprint: SMD; Operating Temperature Range: -40℃~+85℃; Current Rating - Power (Max): 3A

## Nets
3V3: BSL.3 BSL.4 C28.1 C29.1 C38.2 C39.2 C46.2 C47.2 C51.2 C52.2 E1.1 F2.1 L1.2 L2.1 R8.1 R15.1 R24.2 R29.1 U1.40(VDD) U18.7(VCC) U18.10(V3) U24.3(IO2) U24.7(IO3) U24.8(VCC)
+5V: C27.1 C48.2 D1.5(VCC) F1.2 R9.1 U9.1(EN) U9.4(VIN) U23.1(IN)
AGND: C10.1 C11.1 C48.1 C49.1 C50.1 R4.2 R42.1 U21.35 U23.3(GND)
GND: C27.2 C28.2 C29.2 C33.1 C34.2 C35.1 C36.1 C37.1 C38.1 C39.1 C40.2 C46.1 C47.1 C51.1 C52.1 D1.2(GND) E1.2 hole1.1(GND) hole2.1(GND) hole3.1(GND) hole4.1(GND) KEY.3 KEY.4 LINK1.1(K) PWR1.1(K) R0.2 R3.1 R14.2 R18.2 R25.1 R27.2 R28.2 R42.2 RESET.3 RESET.4 U1.41(VSS) U9.2(GND) U18.3(GND) U20.7 U20.8 U21.1 U21.2 U21.21 U21.23 U21.37 U21.39 U22.1 U22.2 U22.21 U22.23 U22.28 U22.37 U22.39 U24.4(GND) USB1.1(SHELL) USB1.2(SHELL) USB1.3(SHELL) USB1.4(SHELL) USB1.A1B12(GND) USB1.B1A12(GND) X1.2(GND) X1.4(GND)
VBUS_5V: F1.1 U20.1 U21.24 U21.40 U22.24 U22.40 USB1.A4B9(VBUS) USB1.B4A9(VBUS)
340_RX: R37.1 U18.9(RXD)
340_TX: D9.1(C) U18.8(TXD)
BLK: H8.8 U1.28(PB26) U21.32
BSLRX: D9.2(A) U1.57(PA11) U20.5 U21.14
BSLTX: R37.2 U1.56(PA10) U20.3 U21.12
EXT_3V3: F2.2 R1.1 R2.2 U20.2 U21.22 U21.38 U22.22 U22.38
EXT_CHIP_VREF+: C49.2 C50.2 R5.2 U21.36 U23.2(OUT)
EXT_PIN_VREF+: R6.2 U22.20
LCD_CS: H8.7 U1.2(PB14) U22.34
LCD_DC: H8.6 U1.63(PB11) U22.33
LCD_RES: H8.5 U1.62(PB10) U22.31
LCD_SCL: H8.3 U1.61(PB9) U21.28 U24.6(CLK)
LCD_SDA: H8.4 U1.60(PB8) U21.27 U24.5(DI)
NRST: C33.2 R24.1 RESET.1 RESET.2 U1.38(NRST) U22.35
PA0: R21.1 U1.33(PA0) U21.3
PA1: R20.1 U1.34(PA1) U21.5
PA2/ROSC: R18.1 U1.42(PA2/ROSC) U22.19
PA3_LFXIN: C36.2 U1.43(PA3/LFXIN) X3.1
PA4_LFXOUT: C37.2 U1.44(PA4/LFXOUT) X3.2
PA5_HFXIN: C34.1 U1.45(PA5/HFXIN) X1.1(OSC1)
PA6_HFXOUT: C35.2 U1.46(PA6/HFXOUT) X1.3(OSC2)
PA7: U1.49(PA7) U22.32
PA8: U1.54(PA8) U21.7
PA9: U1.55(PA9) U21.9
PA12: U1.5(PA12/CAN_TX) U21.29
PA13: U1.6(PA13/CAN_RX) U21.30
PA14: U1.7(PA14) U22.11
PA15: U1.8(PA15/A1_0) U22.12
PA16: U1.9(PA16/A1_1) U22.13
PA17: U1.10(PA17/A1_2) U22.14
PA18/BSL: BSL.1 BSL.2 R25.2 U1.11(PA18/A1_3) U22.36
PA19/SWDIO: U1.12(PA19/SWDIO) U20.6 U21.19
PA20/SWCLK: U1.13(PA20/SWCLK) U20.4 U21.20
PA21/VREF-: C44.1 R4.1 U1.17(PA21/A1_7/VREF-) U22.18
PA22: U1.18(PA22/A0_7) U22.10
PA23/VREF+: C44.2 R5.1 R6.1 R7.1 TP4.1 U1.24(PA23/VREF+)
PA24: U1.25(PA24/A0_3) U22.6
PA25: U1.26(PA25/A0_2) U22.5
PA26: U1.30(PA26/A0_1/CAN_TX) U22.4
PA27: U1.31(PA27/A0_0/CAN_RX) U22.3
PA28: U1.35(PA28) U21.4
PA29: U1.36(PA29) U21.34
PA30: U1.37(PA30) U22.27
PA31: U1.39(PA31) U21.6
PB0/SPI1_CS2: U1.47(PB0) U22.29
PB1/SPI1_CS3: U1.48(PB1) U22.30
PB2: U1.50(PB2) U21.15
PB3: U1.51(PB3) U21.17
PB4: U1.52(PB4) U21.8
PB5: U1.53(PB5) U21.10
PB6: U1.58(PB6) U21.25 U24.1(CS#)
PB7: U1.59(PB7) U21.26 U24.2(DO)
PB12: U1.64(PB12) U21.16
PB13: U1.1(PB13) U21.18
PB15: U1.3(PB15) U21.11
PB16: U1.4(PB16) U21.13
PB17: U1.14(PB17/A1_4) U22.15
PB18: U1.15(PB18/A1_5) U22.16
PB19: U1.16(PB19/A1_6) U22.17
PB20: U1.19(PB20/A0_6) U22.9
PB21: KEY.1 KEY.2 U1.20(PB21) U22.25
PB22: R19.1 U1.21(PB22) U22.26
PB23: U1.22(PB23) U21.31
PB24: U1.23(PB24/A0_5) U22.8
PB25: U1.27(PB25/A0_4) U22.7
PB27: U1.29(PB27) U21.33
USB_D+: D1.1(I/O) D1.6(I/O) U18.1(UD+) USB1.A6(DP1) USB1.B6(DP2)
USB_D-: D1.3(I/O) D1.4(I/O) U18.2(UD-) USB1.A7(DN1) USB1.B7(DN2)
$1N2429: R8.2 R9.2 R20.2 R21.2
$1N2474: C40.1 U1.32(VCORE)
$1N21375: LINK1.2(A) R19.2
$2N936: R28.1 USB1.A5(CC1)
$2N937: R27.1 USB1.B5(CC2)
$2N948: L1.1 U9.3(LX)
$2N949: R14.1 R15.2 U9.5(FB)
$2N956: PWR1.2(A) R29.2
$2N2563: C10.2 C11.2 L2.2 R7.2 TP2.1
$3N2429: H8.1 R0.1 R1.2
$3N2430: H8.2 R2.1 R3.2

Not connected (* = marked no-connect by the designer): U18 4(RTS#)* 5(CTS#)* 6(TNOW)*; USB1 A8(SBU1)* B8(SBU2)*

## Notes on the sheets
sheet 1
- 用户LED
- 精度很重要
- ROSC
- 开漏式IO的上拉电阻
- 复位电路
- 数字地与模拟地单点相连
- VCORE为稳压内核电源输出
- 手册已有说明不能向VCORE引脚提供任何电压或施加任何外部负载
- 如果要使用参考电压则焊接这个0欧姆
- 主控MSPM0G3507-64P
- 功能按键
- 时钟电路
sheet 2
- 可替换22K
- 可替换100K
- VO = 0.6x(1+R1/R2)
- R1=450K
  R2=100K
- USB电源输入与保护
- 板载参考电压芯片
- 三路参考电压，三者存其一，
  连接到外部排针时，左边两
  个电容需要补上。
- 接到外部排针上
- 内部3V3经过磁珠后的电压
- 47R
- 三路参考电压选择
- 外部电压参考
sheet 3
- A0_0
- U0TX
- I2C0-SDA
- I2C0-SDA
- U0TX
- A0_2
- A0_1
- U0RX
- I2C0-SCL
- U1TX
- U1TX
- I2C0-SCL
- U0RX
- A0_4
- A0_6
- A0_3
- A0_5
- U1RX
- U1RX
- A0_12
- A0_7
- U2TX
- A1_1
- A1_0
- U2RX
- A1_4
- A1_2
- U3TX
- U3TX
- A1_6
- A1_5
- A1_7
- U3RX
- U3RX
- PA23
- 这个要通过0R电阻可以选择 1脚接VCC 2脚接GND。
  或者 1脚接GND 2脚接VCC。默认1脚接GND，2脚接VCC
- SPI1_PICO-60
- SPI1_SCK-61
- SPI1_CS0-58
- SPI1_POCI-59
- SPI1_PICO-60
- SPI1_SCK-61
- 还适配SPI接口的0.96寸/1.3寸OLED单色屏幕
- 常用SPI-LCD屏幕接口
- SPI FLASH
- 调试与下载接口
- 串口调试与下载
